# Altium schematic sheet 屏幕驱动.schdoc
size A0; Symbol: Drawing-Symbol_A4; Company: 嘉立创EDA; Version: V1.0; Page Size: A4; @Project Name: 屏幕驱动板; @Update Date: 2026-06-18; @Create Date: 2026-06-18; Device: Drawing-Symbol_A4; @Board Name: Board1; @Page Name: P1; @Create Time: 14:01:21; @Page Count: 1; @Page No: 1; @Schematic Name: Schematic1; @Update Time: 14:01:21; @Assembly Variant: Basic; Border: 1; Title Block Position: 3; Size: A4; Width: 2338; Height: 1652; Region Start: 1; X Region Count: 6; Y Region Count: 4; Blade Width: 10; SheetNumber: 1; SheetTotal: 1
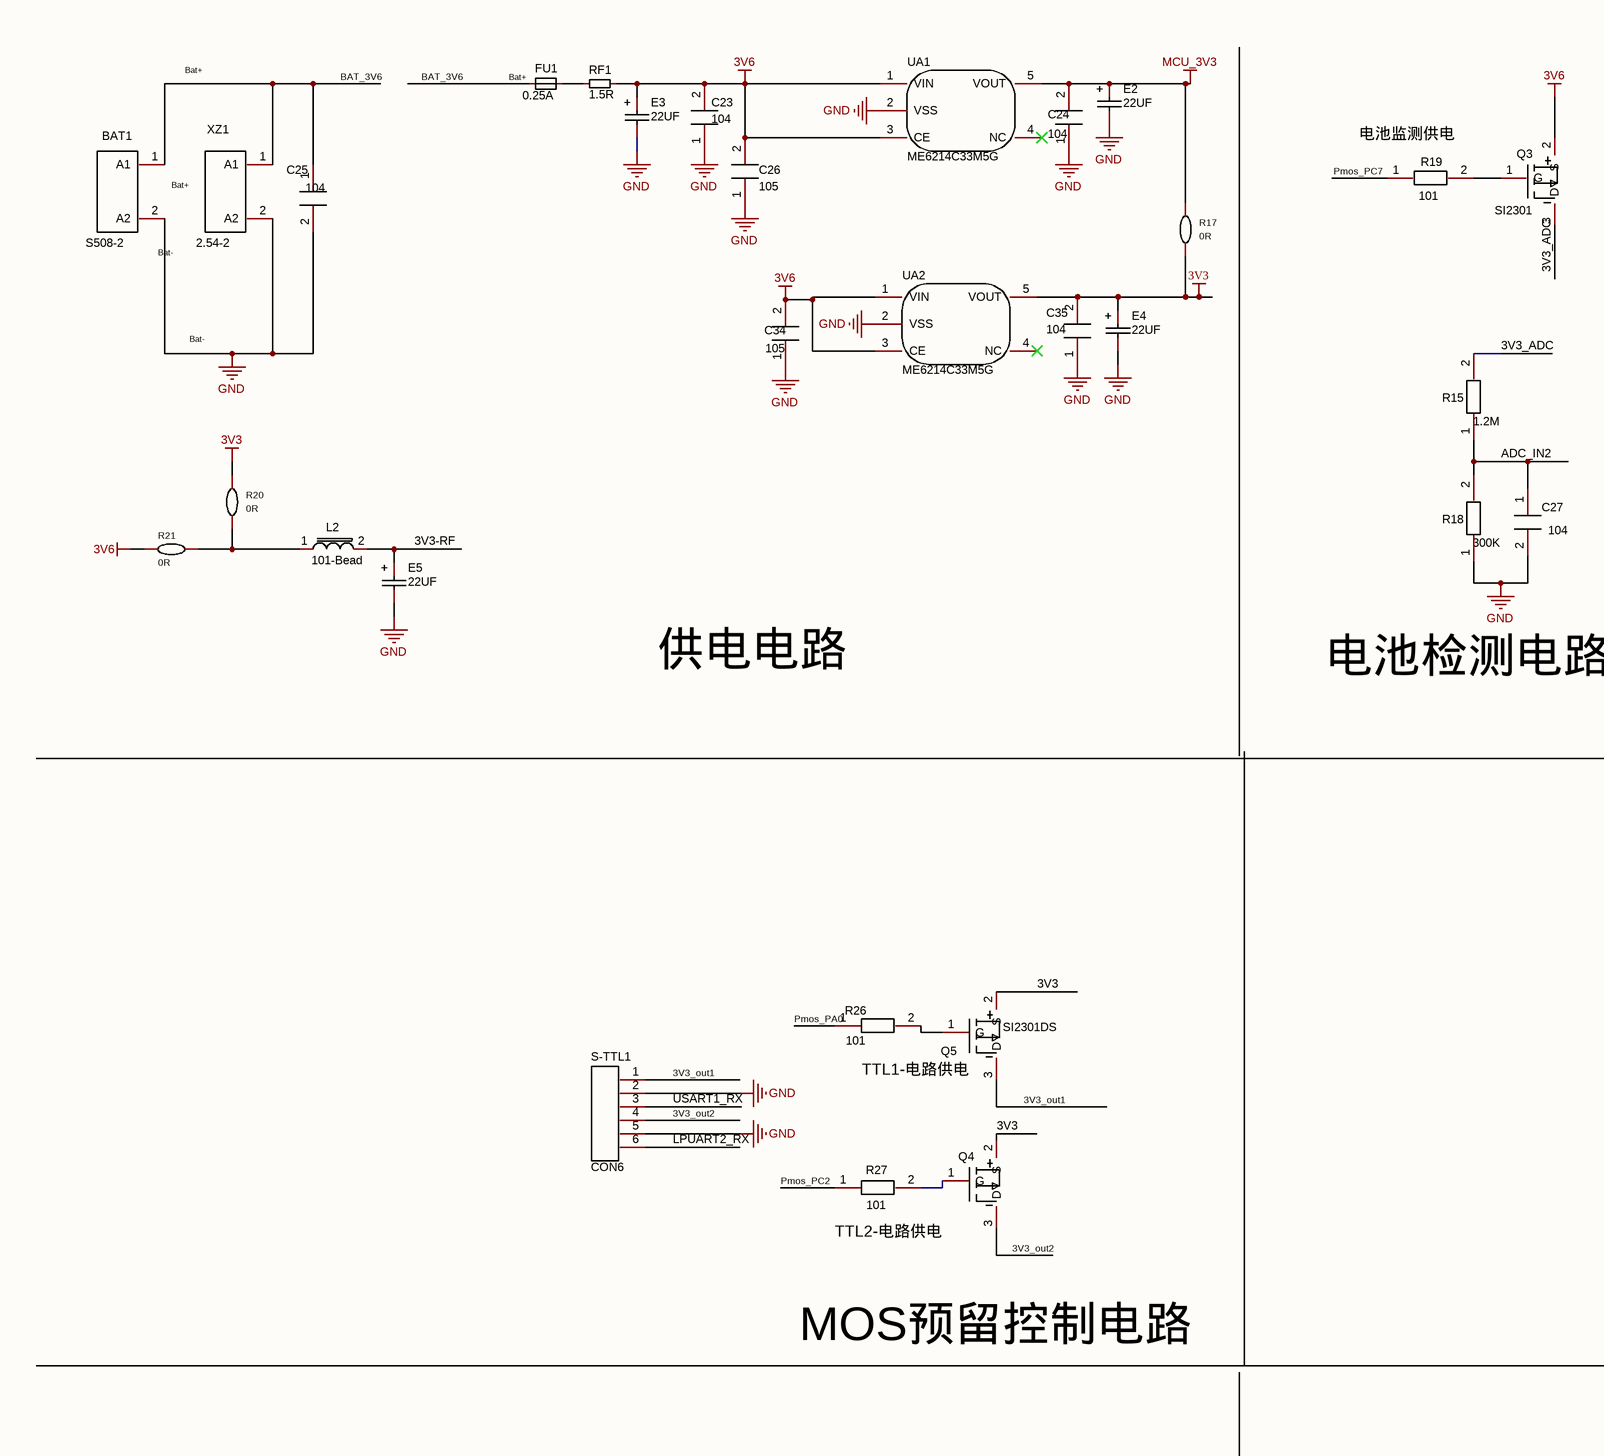
[diagram p0: 屏幕驱动.schdoc, top left]
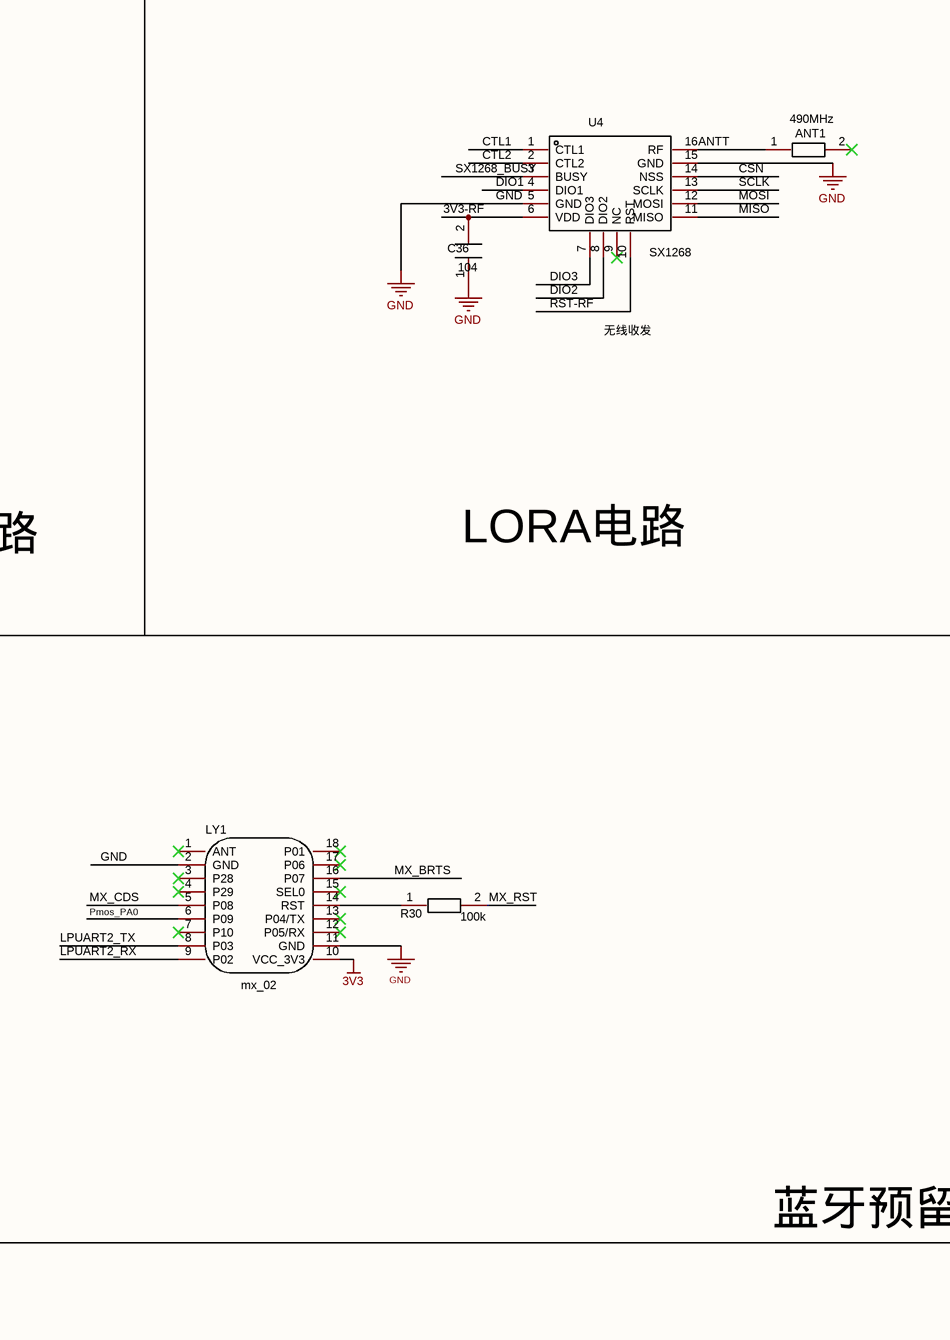
[diagram p1: 屏幕驱动.schdoc, top middle]
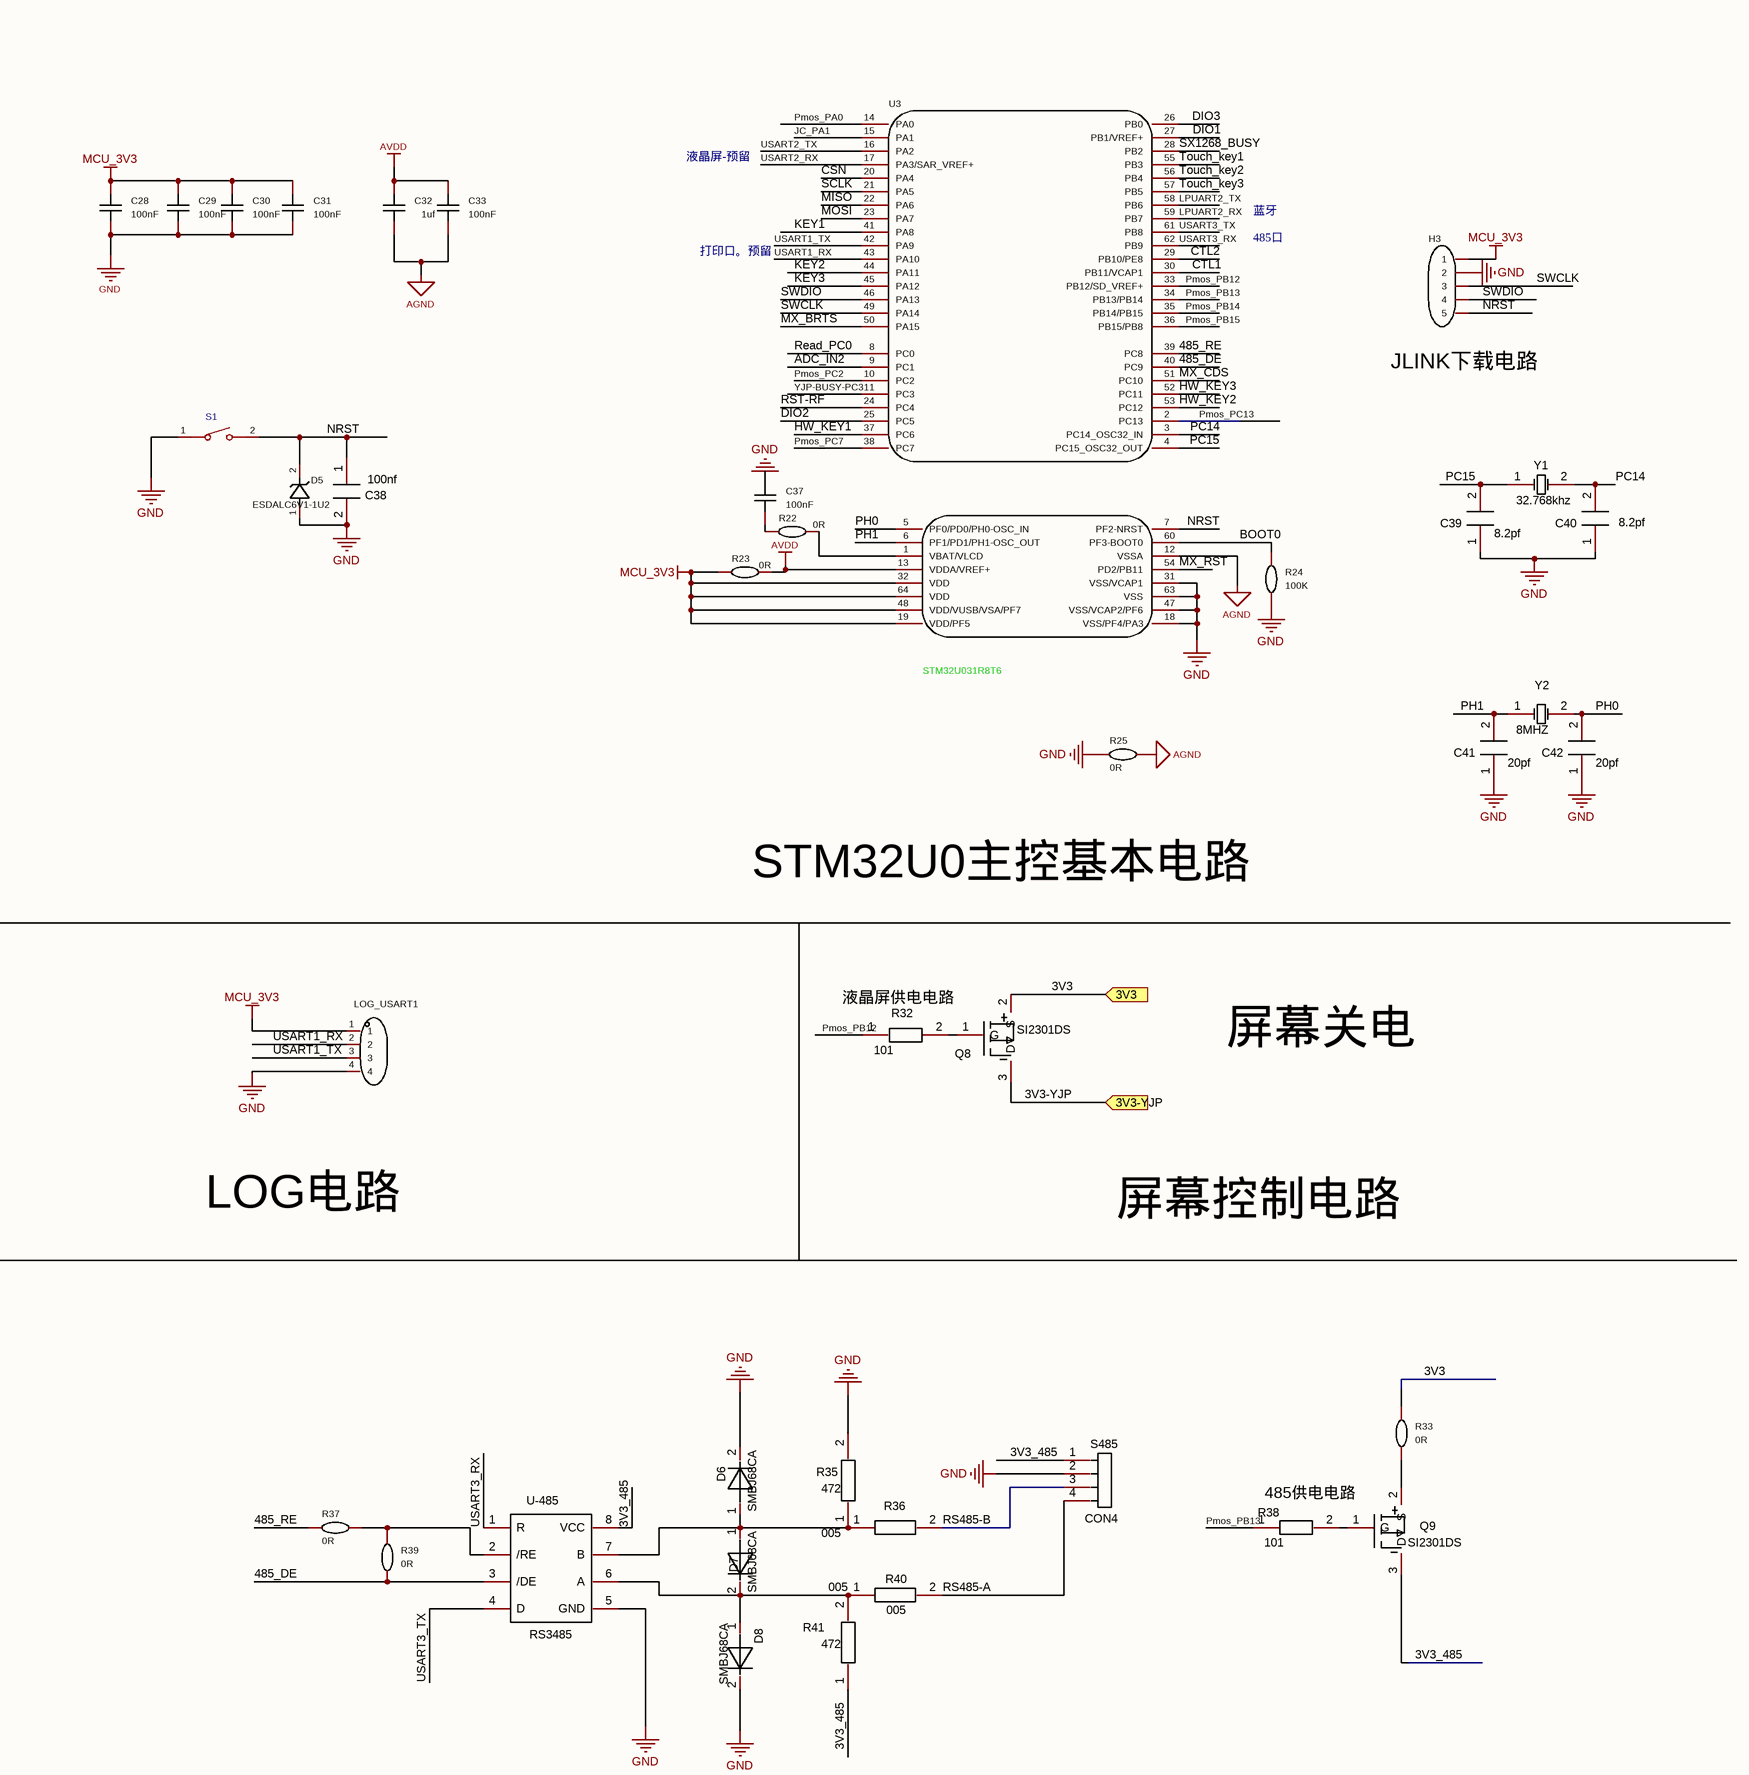
[diagram p2: 屏幕驱动.schdoc, top right]
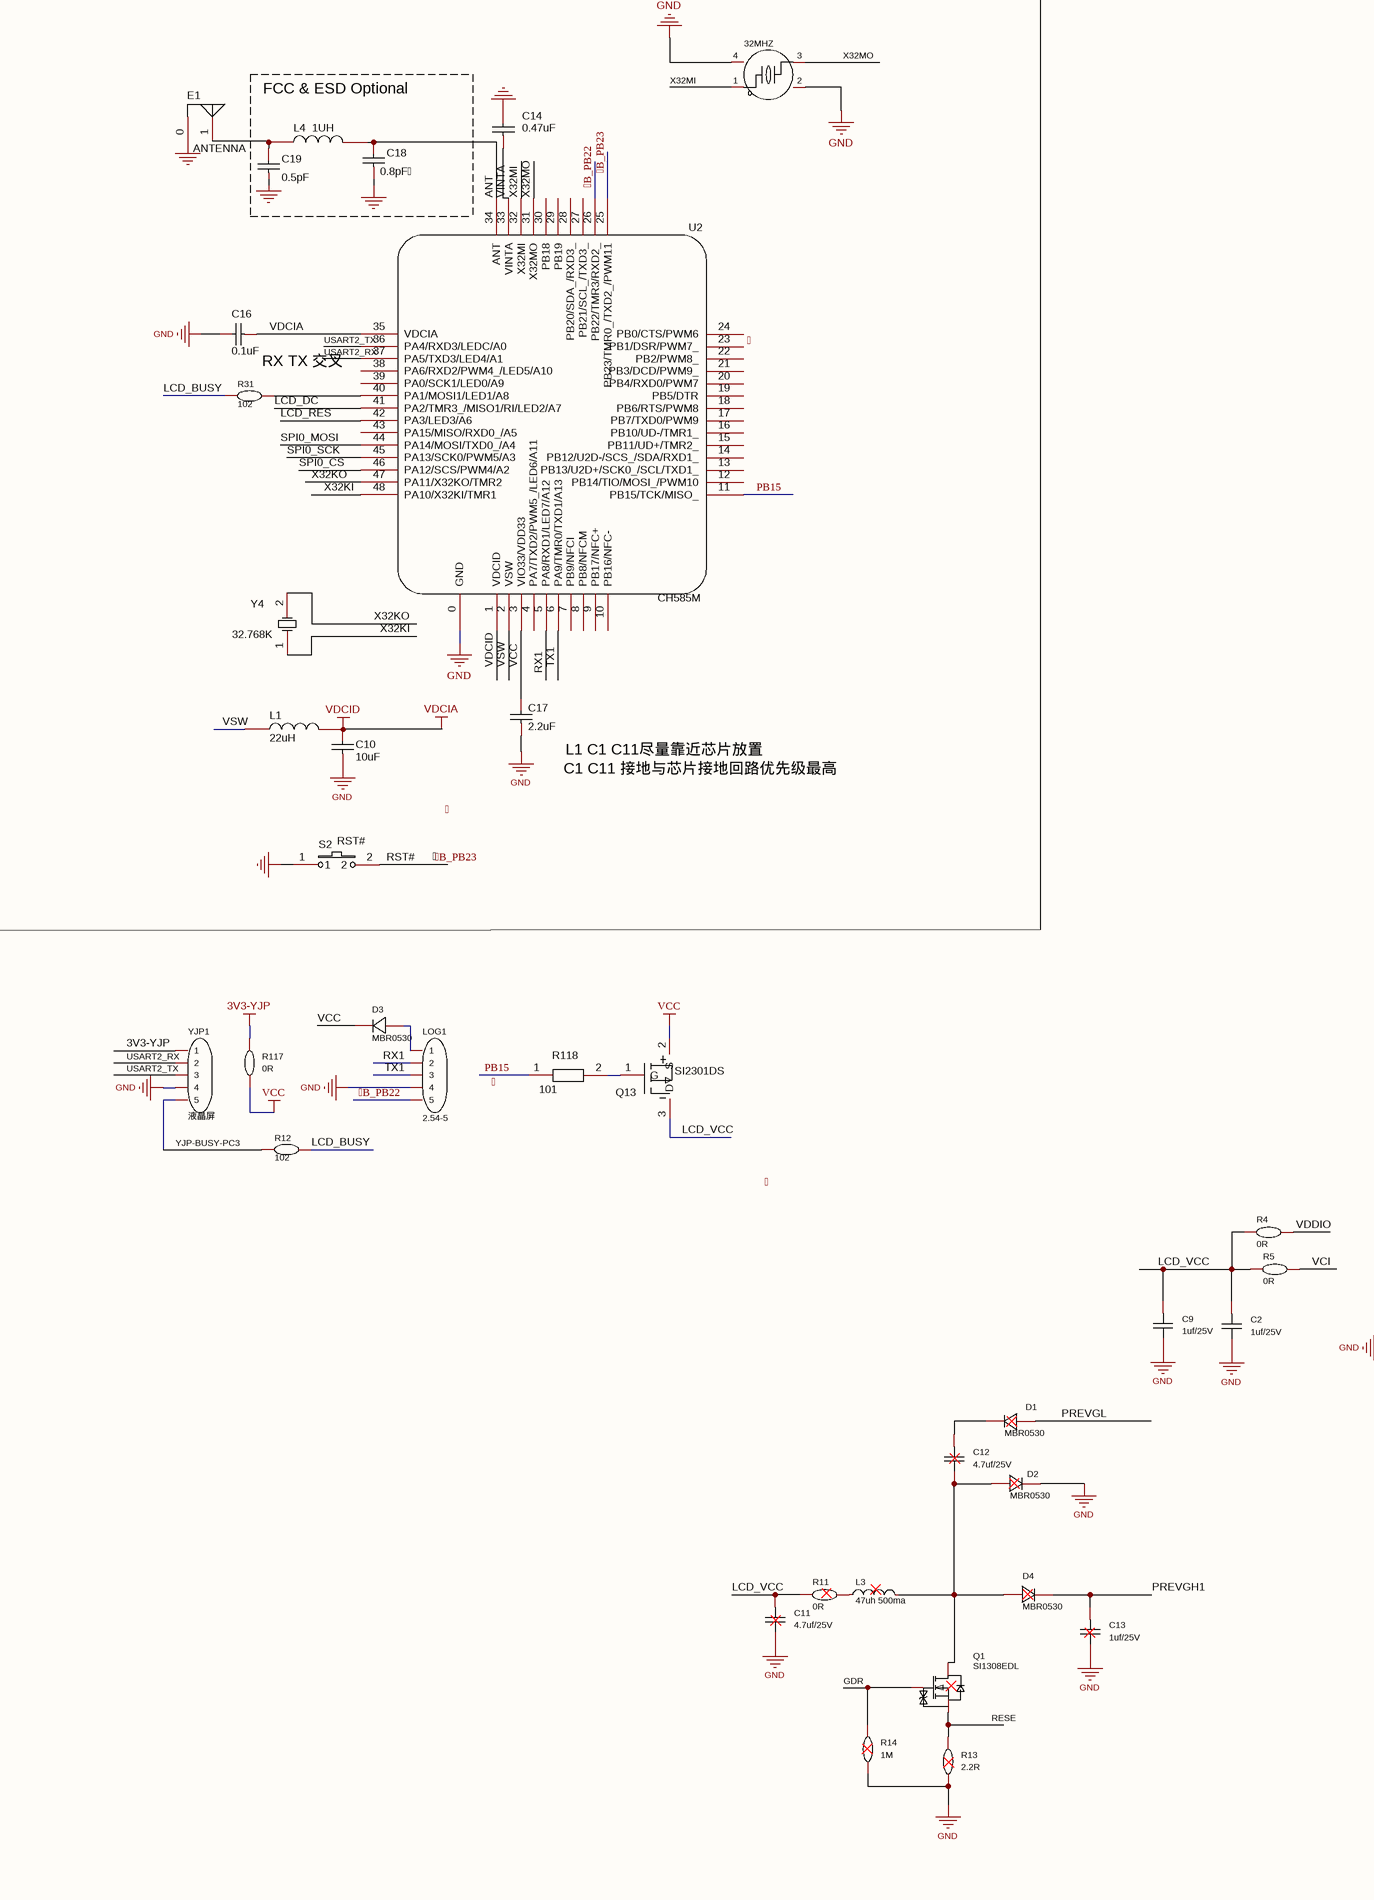
[diagram p3: 屏幕驱动.schdoc, bottom left]
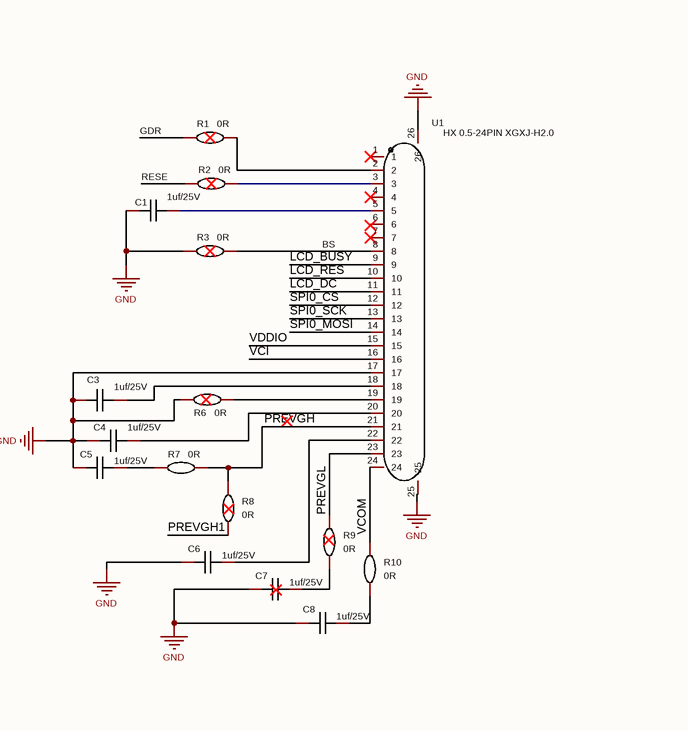
[diagram p4: 屏幕驱动.schdoc, bottom middle]
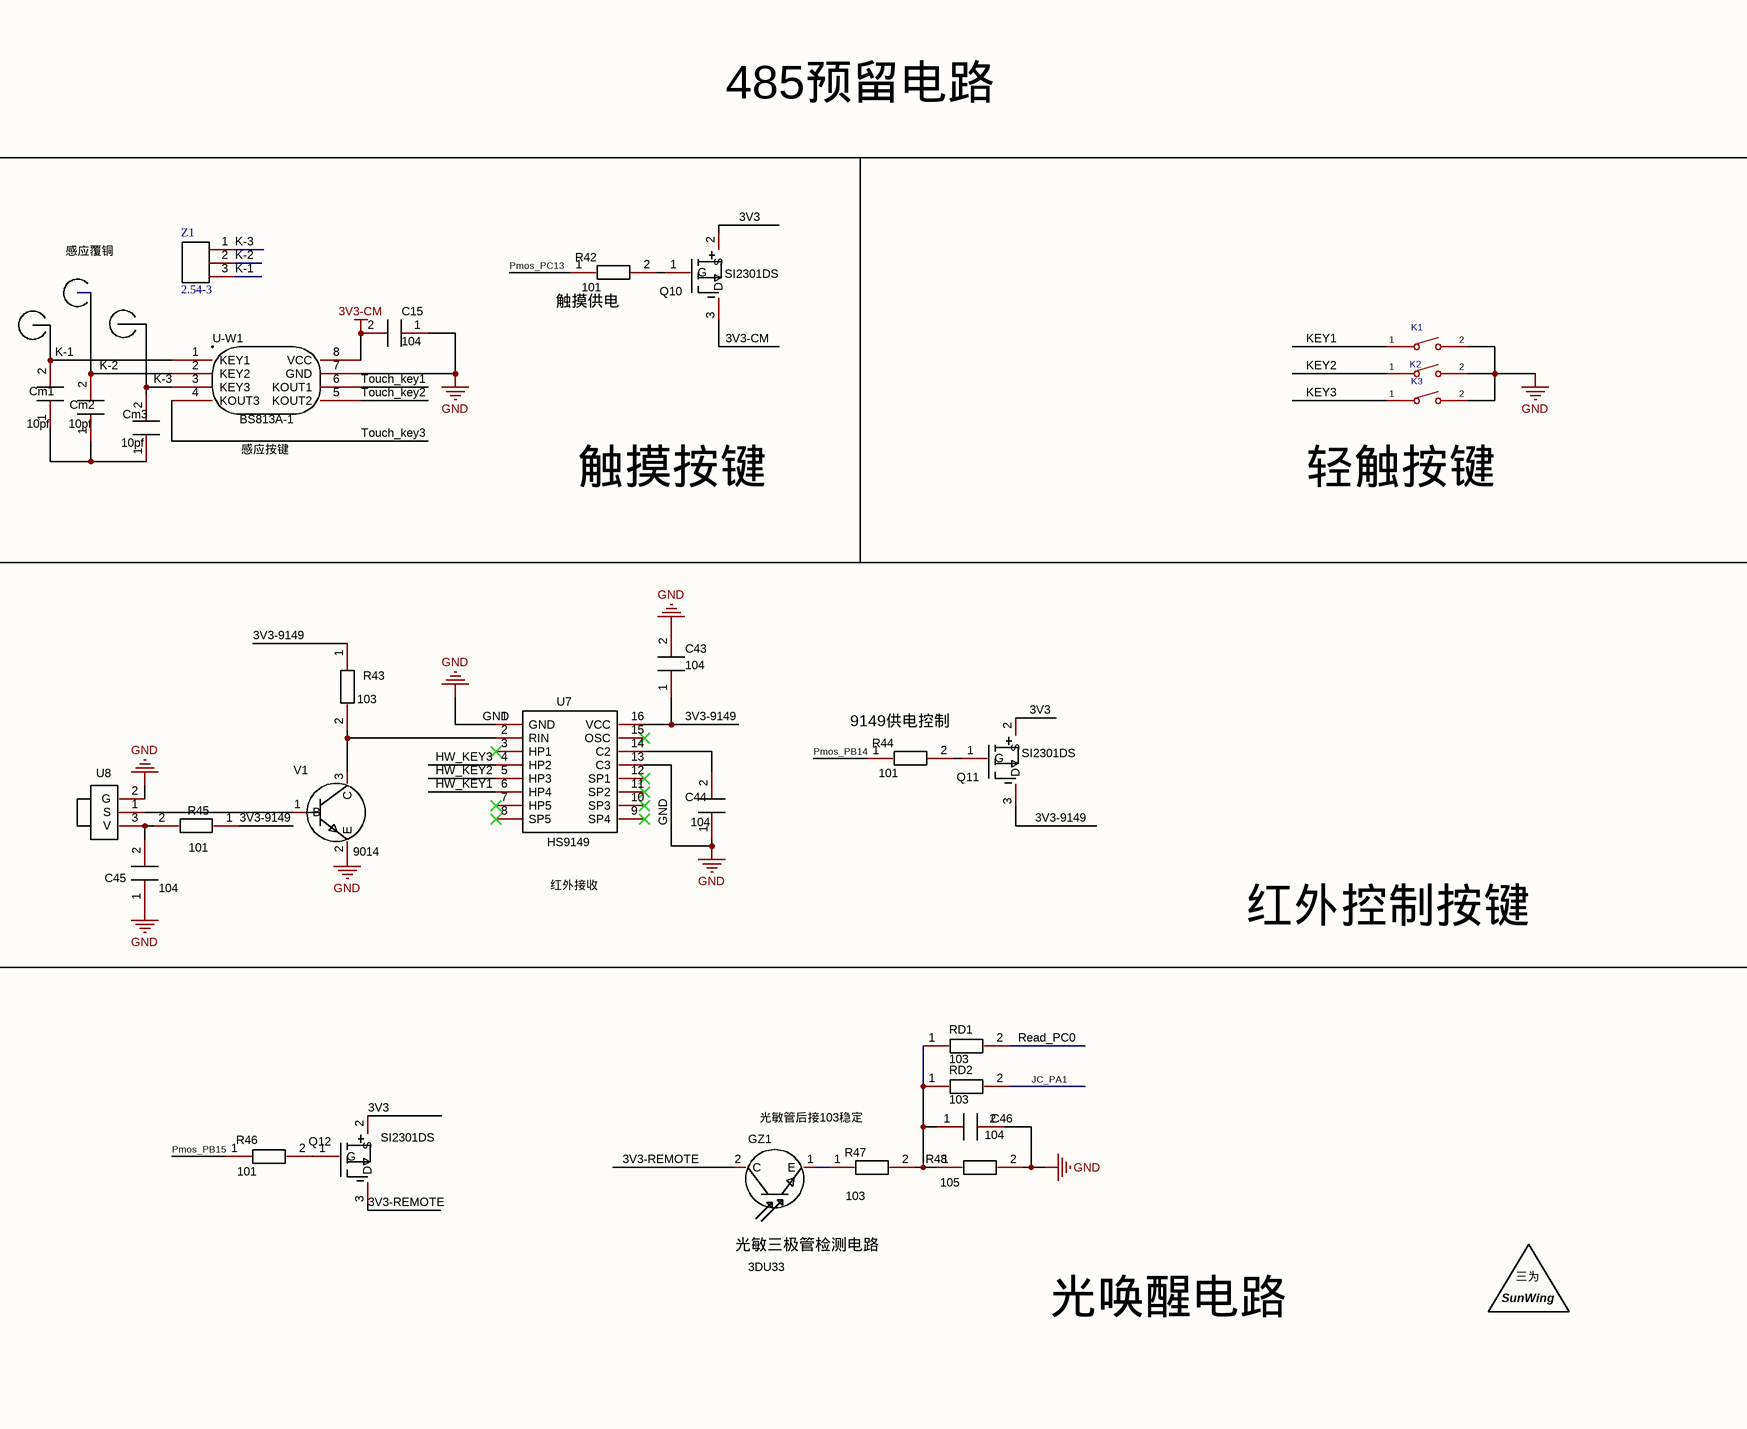
[diagram p5: 屏幕驱动.schdoc, bottom right]

## Parts
32MHZ  (no value)  [32MHZ]
ANT1  value 490MHz  [TX-470-B]
BAT1  S508-2  [5.08HEADER1X2]
C1  1uf/25V  [C 0603]
C2  1uf/25V  [C 0603]
C3  1uf/25V  [C 0603]
C4  1uf/25V  [C 0603]
C5  1uf/25V  [C 0603]
C6  1uf/25V  [C 0603]
C7  1uf/25V  [C 0603]
C8  1uf/25V  [C 0603]
C9  1uf/25V  [C 0603]
C10  10uF  [C 0603]
C11  4.7uf/25V  [C 0603]
C12  4.7uf/25V  [C 0603]
C13  1uf/25V  [C 0603]
C14  0.47uF  [C 0603]
C15  104  [C0603]
C16  0.1uF  [C 0603]
C17  2.2uF  [C 0603]
C18  0.8pF  [C 0603]
C19  0.5pF  [C 0603]
C23  104  [C0603]
C24  104  [C0603]
C25  104  [C0603]
C26  105  [C0603]
C27  104  [C0603]
C28  100nF  [C0603]
C29  100nF  [C0603]
C30  100nF  [C0603]
C31  100nF  [C0603]
C32  1uf  [C0603]
C33  100nF  [C0603]
C34  105  [C0603]
C35  104  [C0603]
C36  104  [C0603]
C37  100nF  [C0603]
C38  100nf  [C0603]
C39  8.2pf  [C0603]
C40  8.2pf  [C0603]
C41  20pf  [C0603]
C42  20pf  [C0603]
C43  104  [C0603]
C44  104  [C0603]
C45  104  [C0603]
C46  104  [C0603]
Cm1  10pf  [C0603]
Cm2  10pf  [C0603]
Cm3  10pf  [C0603]
D1  MBR0530  [SOD-123_L2.7-W1.6-LS3.7-RD-1]
D2  MBR0530  [SOD-123_L2.7-W1.6-LS3.7-RD-1]
D3  MBR0530  [SOD-123_L2.7-W1.6-LS3.7-RD-1]
D4  MBR0530  [SOD-123_L2.7-W1.6-LS3.7-RD-1]
D5  ESDALC6V1-1U2  [SMB]
D6  SMBJ68CA  [SMB]
D7  SMBJ68CA  [SMB]
D8  SMBJ68CA  [SMB]
E1  ANTENNA  [U.FL-IPEX]
E2  22UF  [1210C]
E3  22UF  [1210C]
E4  22UF  [1210C]
E5  22UF  [1210C]
FU1  0.25A  [FU1808-1A]
GZ1  3DU33  [3DU33]
H3  (no value)  [HDR1X5]
K1  TS-1088-AR02016  [SMD4*3*2]  (value not drawn)
K2  TS-1088-AR02016  [SMD4*3*2]  (value not drawn)
K3  TS-1088-AR02016  [SMD4*3*2]  (value not drawn)
L1  22uH  [CD43]
L2  101-Bead  [0805L]
L3  47uh 500ma  [CD43]
L4  1UH  [L  0603]
LOG1  2.54-5  [HDR2.54-LI-5P]
LOG_USART1  (no value)  [HDR1X4]
LY1  mx_02  [MX_02]
Q1  SI1308EDL  [SOT-23-123]
Q3  SI2301  [SOT-23L]
Q4  (no value)  [SOT-23-123]
Q5  value SI2301DS  [SOT-23-123]
Q8  value SI2301DS  [SOT-23-123]
Q9  value SI2301DS  [SOT-23-123]  (hidden comment: SI2301)
Q10  value SI2301DS  [SOT-23-123]
Q11  value SI2301DS  [SOT-23-123]
Q12  value SI2301DS  [SOT-23-123]
Q13  SI2301DS  [SOT-23-123]
R1  0R  [R 0603]
R2  0R  [R 0603]
R3  0R  [R 0603]
R4  0R  [R 0603]
R5  0R  [R 0603]
R6  0R  [R 0603]
R7  0R  [R 0603]
R8  0R  [R 0603]
R9  0R  [R 0603]
R10  0R  [R 0603]
R11  0R  [R 0603]
R12  102  [R 0603]
R13  2.2R  [R 0603]
R14  1M  [R 0603]
R15  value 1.2M  [R 0603_L]
R17  0R  [DJ6MIL]
R18  value 300K  [R 0603_L]
R19  value 101  [R0603]
R20  0R  [R0603]
R21  0R  [R0603]
R22  0R  [R0603]
R23  0R  [R0603]
R24  100K  [R0603]
R25  0R  [R0603]
R26  101  [R0603]
R27  value 101  [R0603]
R30  100k  [R0603]
R31  102  [R 0603]
R32  101  [R0603]
R33  0R  [R0603]
R35  472  [R0603]
R36  005  [R0603]
R37  0R  [R0603]
R38  101  [R0603]
R39  0R  [R0603]
R40  005  [R0603]
R41  472  [R0603]
R42  101  [R0603]
R43  value 103  [R0603]
R44  101  [R0603]
R45  101  [R0603]
R46  101  [R0603]
R47  103  [R0603]
R48  105  [R0603]
R117  0R  [DJ6MIL]
R118  101  [R 0603]
RD1  103  [R0603]
RD2  103  [R0603]
RF1  1.5R  [R 1210_L]
S1  TS-1088-AR02016  [SMD4*3*2]  (value not drawn)
S2  RST#  [SMD4*3*2]
S485  5.08-4  [2.54-S-4]  (value not drawn)
S-TTL1  CON6  [2.54-S-6]
singwing1  SUNWING  [SUNWING]  (value not drawn)
U1  HX 0.5-24PIN XGXJ-H2.0  [FPC-SMD_24P-P0.50_SHOU-HAN_CTSJ-H2.0]
U2  CH585M  [CH584]
U3  (no value)  [LQFP-64_L10.0-W10.0-P0.50-LS12.0-BL]
U4  SX1268  [RF]
U7  HS9149  [SOP16]
U8  HS38BD  [HS/VS1838]  (value not drawn)
U-485  RS3485  [SOP8]
U-W1  BS813A-1  [SOP8]
UA1  ME6214C33M5G  [SOT23-5]
UA2  ME6214C33M5G  [SOT23-5]
V1  9014  [SOT-23-123]
XZ1  2.54-2  [XH2.54-LI-2P]
Y1  32.768khz  [FC-135]
Y2  8MHZ  [OSC HC-49SMD-L]
Y4  32.768K  [FC-135]
YJP1  液晶屏  [液晶屏4.2]
Z1  2.54-3  [XH2.54-LI-3P]

## Blocks framed on the sheet
FCC & ESD Optional: C18 C19 L4

## Ports
3V3 (in), 3V3-YJP (in)

## Nets
3V3: C35.2 E4.1 LY1.10(VCC_3V3) Q4.2(S) Q5.2(S) Q8.2(S) Q10.2(S) Q11.2(S) Q12.2(S) R17.1 R20.2 R33.2 UA2.5(VOUT) ; port 3V3
3V3-CM: C15.2 Q10.3(D) U-W1.8(VCC)
3V3-YJP: Q8.3(D) R117.2 YJP1.1 ; port 3V3-YJP
3V6: C23.2 C26.2 C34.2 E3.1 Q3.2(S) R21.1 RF1.2 UA1.1(VIN) UA1.3(CE) UA2.1(VIN) UA2.3(CE)
AGND: C32.1 C33.1 R25.2 U3.12(VSSA)
AVDD: C32.2 C33.2 R23.2 U3.13(VDDA/VREF+)
GND: 32MHZ.2(GND) 32MHZ.4(GND) BAT1.2(A2) C1.1 C2.1 C3.1 C4.1 C5.1 C6.1 C7.1 C8.1 C9.1 C10.1 C11.1 C13.1 C14.2 C15.1 C16.2 C17.1 C18.1 C19.1 C23.1 C24.1 C25.2 C26.1 C27.2 C28.1 C29.1 C30.1 C31.1 C34.1 C35.1 C36.1 C37.2 C38.2 C39.1 C40.1 C41.1 C42.1 C43.2 C44.1 C45.1 C46.2 D2.1(C) D5.1(K) D6.2 D8.2 E1.0(A) E2.2 E3.2 E4.2 E5.2 H3.2 K1.2 K2.2 K3.2 LOG1.4 LOG_USART1.4 LY1.2(GND) LY1.11(GND) R3.1 R6.1 R13.1 R14.1 R18.1 R24.1 R25.1 R35.2 R48.2 S1.1 S2.1 S485.2 S-TTL1.2 S-TTL1.5 U1.17 U1.25 U1.26 U2.0(GND) U3.18(VSS/PF4/PA3) U3.31(VSS/VCAP1) U3.47(VSS/VCAP2/PF6) U3.63(VSS) U4.5(GND) U4.15(GND) U7.1(GND) U7.13(C3) U8.2(G) U-485.5(GND) U-W1.7(GND) UA1.2(VSS) UA2.2(VSS) V1.2(E) XZ1.2(A2) YJP1.4
MCU_3V3: C24.2 C28.2 C29.2 C30.2 C31.2 E2.1 H3.1 LOG_USART1.1 R17.2 R23.1 U3.19(VDD/PF5) U3.32(VDD) U3.48(VDD/VUSB/VSA/PF7) U3.64(VDD) UA1.5(VOUT)
VCC: C17.2 D3.1(C) Q13.2(S) R117.1 U2.3(VIO33/VDD33)
VDCIA: C10.2 C16.1 L1.2 U2.1(VDCID) U2.35(VDCIA)  [also labelled VDCID]
3V3-9149: C43.1 Q11.3(D) R43.1 R45.1 U7.16(VCC)
3V3-REMOTE: GZ1.2(C) Q12.3(D)
3V3-RF: C36.2 E5.1 L2.2 U4.6(VDD)
3V3_485: Q9.3(D) R41.1 S485.1 U-485.8(VCC)
3V3_ADC: Q3.3(D) R15.2
3V3_out1: Q5.3(D) S-TTL1.1
3V3_out2: Q4.3(D) S-TTL1.4
485_DE: R39.1 U3.40(PC9) U-485.3(/DE)
485_RE: R37.1 U3.39(PC8)
B_PB22: LOG1.5 U2.26(PB22/TMR3/RXD2_)
B_PB23: S2.2 U2.25(PB23/TMR0_/TXD2_/PWM11)  [also labelled RST#]
ADC_IN2: C27.1 R15.1 R18.2 U3.9(PC1)
ANT: C18.2 L4.2 U2.34(ANT)
ANTT: ANT1.1 U4.16(RF)
BAT_3V6: BAT1.1(A1) C25.1 FU1.1 XZ1.1(A1)
BOOT0: R24.2 U3.60(PF3-BOOT0)
BS: R3.2 U1.8
CSN: U3.20(PA4) U4.14(NSS)
CTL1: U3.30(PB11/VCAP1) U4.1(CTL1)
CTL2: U3.29(PB10/PE8) U4.2(CTL2)
DIO1: U3.27(PB1/VREF+) U4.4(DIO1)
DIO2: U3.25(PC5) U4.8(DIO2)
DIO3: U3.26(PB0) U4.7(DIO3)
GDR: Q1.1(G) R1.1 R14.2
HW_KEY1: U3.37(PC6) U7.6(HP4)
HW_KEY2: U3.53(PC12) U7.5(HP3)
HW_KEY3: U3.52(PC11) U7.4(HP2)
JC_PA1: RD2.2 U3.15(PA1)
K-1: Cm1.2 U-W1.1(KEY1) Z1.3
K-2: Cm2.2 U-W1.2(KEY2) Z1.2
K-3: Cm3.2 U-W1.3(KEY3) Z1.1
KEY1: K1.1 U3.41(PA8)
KEY2: K2.1 U3.44(PA11)
KEY3: K3.1 U3.45(PA12)
LCD_BUSY: R12.2 R31.1 U1.9
LCD_DC: U1.11 U2.41(PA2/TMR3_/MISO1/RI/LED2/A7)
LCD_RES: U1.10 U2.42(PA3/LED3/A6)
LCD_VCC: C2.2 C9.2 C11.2 Q13.3(D) R4.1 R5.1 R11.1
LPUART2_RX: LY1.9(P02) S-TTL1.6 U3.59(PB7)
LPUART2_TX: LY1.8(P03) U3.58(PB6)
MISO: U3.22(PA6) U4.11(MISO)
MOSI: U3.23(PA7) U4.12(MOSI)
MX_BRTS: LY1.16(P07) U3.50(PA15)
MX_CDS: LY1.5(P08) U3.51(PC10)
MX_RST: R30.2 U3.54(PD2/PB11)
NRST: C38.1 D5.2(A) H3.5 S1.2 U3.7(PF2-NRST)
PB15: R118.1 U2.11(PB15/TCK/MISO_)
PC14: C40.2 U3.3(PC14_OSC32_IN) Y1.2(OSC2)
PC15: C39.2 U3.4(PC15_OSC32_OUT) Y1.1(OSC1)
PH0: C42.2 U3.5(PF0/PD0/PH0-OSC_IN) Y2.2(OSC2)
PH1: C41.2 U3.6(PF1/PD1/PH1-OSC_OUT) Y2.1(OSC1)
Pmos_PA0: LY1.6(P09) R26.1 U3.14(PA0)
Pmos_PB12: R32.1 U3.33(PB12/SD_VREF+)
Pmos_PB13: R38.1 U3.34(PB13/PB14)
Pmos_PB14: R44.1 U3.35(PB14/PB15)
Pmos_PB15: R46.1 U3.36(PB15/PB8)
Pmos_PC2: R27.1 U3.10(PC2)
Pmos_PC7: R19.1 U3.38(PC7)
Pmos_PC13: R42.1 U3.2(PC13)
PREVGH: R7.2 R8.2 U1.21
PREVGH1: C13.2 D4.1(C) R8.1
PREVGL: D1.2(A) R9.2 U1.23
Read_PC0: RD1.2 U3.8(PC0)
RESE: Q1.2(S) R2.1 R13.2
RS485-A: R40.2 S485.4
RS485-B: R36.2 S485.3
RST-RF: U3.24(PC4) U4.10(RST)
RX1: LOG1.2 U2.5(PA8/RXD1/LED7/A12)
SCLK: U3.21(PA5) U4.13(SCLK)
SPI0_CS: U1.12 U2.46(PA12/SCS/PWM4/A2)
SPI0_MOSI: U1.14 U2.44(PA14/MOSI/TXD0_/A4)
SPI0_SCK: U1.13 U2.45(PA13/SCK0/PWM5/A3)
SWCLK: H3.3 U3.49(PA14)
SWDIO: H3.4 U3.46(PA13)
SX1268_BUSY: U3.28(PB2) U4.3(BUSY)
Touch_key1: U3.55(PB3) U-W1.6(KOUT1)
Touch_key2: U3.56(PB4) U-W1.5(KOUT2)
Touch_key3: U3.57(PB5) U-W1.4(KOUT3)
TX1: LOG1.3 U2.6(PA9/TMR0/TXD1/A13)
USART1_RX: LOG_USART1.2 S-TTL1.3 U3.43(PA10)
USART1_TX: LOG_USART1.3 U3.42(PA9)
USART2_RX: U2.37(PA5/TXD3/LED4/A1) U3.17(PA3/SAR_VREF+) YJP1.2
USART2_TX: U2.36(PA4/RXD3/LEDC/A0) U3.16(PA2) YJP1.3
USART3_RX: U3.62(PB9) U-485.1(R)
USART3_TX: U3.61(PB8) U-485.4(D)
VCI: R5.2 U1.16
VCOM: R10.2 U1.24
VDDIO: R4.2 U1.15
VINTA: C14.1 U2.33(VINTA)
VSW: L1.1 U2.2(VSW)
X32KI: U2.48(PA10/X32KI/TMR1) Y4.1(OSC1)
X32KO: U2.47(PA11/X32KO/TMR2) Y4.2(OSC2)
X32MI: 32MHZ.1 U2.32(X32MI)
X32MO: 32MHZ.3 U2.31(X32MO)
YJP-BUSY-PC3: R12.1 U3.11(PC3) YJP1.5
NetC1_2: C1.2 U1.5
NetC3_2: C3.2 U1.18
NetC4_2: C4.2 U1.20
NetC5_2: C5.2 R7.1
NetC6_2: C6.2 U1.22
NetC7_2: C7.2 R9.1
NetC8_2: C8.2 R10.1
NetC12_1: C12.1 D2.2(A) D4.2(A) L3.2 Q1.3(D)
NetC12_2: C12.2 D1.1(C)
NetC19_2: C19.2 E1.1(A) L4.1
NetC37_1: C37.1 R22.1
NetC44_2: C44.2 U7.14(C2)
NetC45_2: C45.2 R45.2 U8.3(V)
NetC46_1: C46.1 R47.2 R48.1 RD1.1 RD2.1
NetCm1_1: Cm1.1 Cm2.1 Cm3.1
NetD3_2: D3.2(A) LOG1.1
NetD6_1: D6.1 D7.1 R35.1 R36.1 U-485.7(B)
NetD7_2: D7.2 D8.1 R40.1 R41.2 U-485.6(A)
NetFU1_2: FU1.2 RF1.1
NetGZ1_1: GZ1.1(E) R47.1
NetL2_1: L2.1 R20.1 R21.2
NetL3_1: L3.1 R11.2
NetLY1_14: LY1.14(RST) R30.1
NetQ3_1: Q3.1(G) R19.2
NetQ4_1: Q4.1(G) R27.2
NetQ5_1: Q5.1(G) R26.2
NetQ8_1: Q8.1(G) R32.2
NetQ9_1: Q9.1(G) R38.2
NetQ9_2: Q9.2(S) R33.1
NetQ10_1: Q10.1(G) R42.2
NetQ11_1: Q11.1(G) R44.2
NetQ12_1: Q12.1(G) R46.2
NetQ13_1: Q13.1(G) R118.2
NetR1_2: R1.2 U1.2
NetR2_2: R2.2 U1.3
NetR6_2: R6.2 U1.19
NetR22_2: R22.2 U3.1(VBAT/VLCD)
NetR31_2: R31.2 U2.40(PA1/MOSI1/LED1/A8)
NetR37_2: R37.2 R39.2 U-485.2(/RE)
NetR43_2: R43.2 U7.2(RIN) V1.3(C)
NetU8_1: U8.1(S) V1.1(B)

Not connected (* = marked no-connect by the designer): ANT1 2*; LY1 1(ANT)* 3(P28)* 4(P29)* 7(P10)* 12(P05/RX)* 13(P04/TX)* 15(SEL0)* 17(P06)* 18(P01)*; U1 1* 4* 6 7*; U2 4(PA7/TXD2/PWM5_/LED6/A11) 7(PB9/NFCI) 8(PB8/NFCM) 9(PB17/NFC+) 10(PB16/NFC-) 12(PB14/TIO/MOSI_/PWM10) 13(PB13/U2D+/SCK0_/SCL/TXD1_) 14(PB12/U2D-/SCS_/SDA/RXD1_) 15(PB11/UD+/TMR2_) 16(PB10/UD-/TMR1_) 17(PB7/TXD0/PWM9) 18(PB6/RTS/PWM8) 19(PB5/DTR) 20(PB4/RXD0/PWM7) 21(PB3/DCD/PWM9_) 22(PB2/PWM8_) 23(PB1/DSR/PWM7_) 24(PB0/CTS/PWM6) 27(PB21/SCL_/TXD3_) 28(PB20/SDA_/RXD3_) 29(PB19) 30(PB18) 38(PA6/RXD2/PWM4_/LED5/A10) 39(PA0/SCK1/LED0/A9) 43(PA15/MISO/RXD0_/A5); U4 9(NC)*; U7 3(HP1)* 7(HP5)* 8(SP5)* 9(SP4)* 10(SP3)* 11(SP2)* 12(SP1)* 15(OSC)*; UA1 4(NC)*; UA2 4(NC)*

## Notes on the sheet
- Bat+
- (near FU1) Bat+
- (near R19) 电池监测供电
- (near BAT1) Bat+
- 液晶屏-预留
- (near BAT1) Bat-
- 打印口。预留
- 蓝牙
- 485口
- Bat-
- (near H3) JLINK下载电路
- 无线收发
- 供电电路
- 电池检测电路
- LORA电路
- STM32U0主控基本电路
- (near R32) 液晶屏供电电路
- TTL1-电路供电
- 屏幕关电
- (near R27) TTL2-电路供电
- LOG电路
- 屏幕控制电路
- MOS预留控制电路
- 蓝牙预留电路
- (near R38) 485供电电路
- RX TX 交叉
- 485预留电路
- 感应覆铜
- (near R42) 触摸供电
- (near U-W1) 感应按键
- C1 C11 接地与芯片接地回路优先级最高
- (near C17) L1 C1 C11尽量靠近芯片放置
- 触摸按键
- (near K3) 轻触按键
- (near R44) 9149供电控制
- 红外接收
- 红外控制按键
- 光敏管后接103稳定
- 光敏三极管检测电路
- 光唤醒电路
- Labels drawn without touching a wire or pin: 
- 创建日期
- 2026-06-18
- 原理图
- 板子
- Schematic1
- Board1
- 更新日期
- 图页
- P1
- 绘制
- 审阅
- 屏幕驱动板
- 版本
- V1.0
- 尺寸
- A4
- 页    1    共    1
- 嘉立创EDA
- (in symbol STM32u031R8T6) STM32U031R8T6
- (in symbol SUNWING) 三为; SunWing
- (in symbol 钽电容) +

## Library data of the parts
32MHZ = SMD3325-4PCristal32MHZ: Manufacturer: YL(惠伦晶体); Manufacturer Part: 3S32000136; Value: 32MHz; Crystal Type: 贴片晶振; Normal temperature Frequency Tolerance: ±10ppm; External load capacitor: 8pF; Frequency Stability(Full temperature range): ±20ppm; Equivalent Series Resistance (ESR): 30Ω; Origin Footprint 2: OSC-SMD_4P-L3.2-W2.5-BL; AddInBom: yes; Symbol: SMD3325-4PCristal32MHZ; Device: SMD3325-4PCristal32MHZ; Supplier: LCSC; Supplier Part: C516583; JLCPCB Part Class: Extended Part; LCSC Part Name: 32MHz ±10ppm 8pF; Supplier Footprint: SMD3225-4P; Datasheet: https://atta.szlcsc.com/upload/public/pdf/source/20200424/C516567_686309201FBE57D70798F9FD1221EE82.pdf; Operating Temperature: -40℃~+85℃; ConvertToPcb: yes; FootprintName: SMD3225-4PCristal32MHZ
ANT1 = RES_3: Symbol: RES; PCB DECAL: 0603R; AddInBom: yes; Device: RES_3; Origin Footprint: TX-470-B; DesignItemID: RES; LibraryName: *
BAT1 = CON2_1: Symbol: CON2; AddInBom: yes; Device: CON2_1; PCB DECAL: 5.08HEADER1X2; Origin Footprint: 5.08HEADER1X2; DesignItemID: CON2; LibraryName: *
C1-C9 C11-C13 C28-C33 C37 = CAP_0603: Symbol: Capacitance; ConvertToPcb: yes; ModelId: ac125912035d415993ca9572d50418b1聨0819f05c4eef4c71ace90d822a990e87; ModelName: C0603_L1.6-W0.8-H0.8; ModelTransform: 62.992,31.496,0,0,0,0,0,0,0; Device: CAP_0603; AddInBom: yes; Supplier Footprint: 0603; FootprintName: C0603
  C1-C9 C13: Value: 1uf/25V
  C11 C12: Value: 4.7uf/25V
  C28-C31 C33 C37: Value: 100nF
  C32: Value: 1uf
C10 = 4.7uF: Capacitor; Symbol: CAP; Origin Footprint: 0402_C; AddInBom: yes; Device: 4.7uF; DesignItemID: CAP; LibraryName: *
C14 = 0.47uF: Capacitor; Symbol: CAP; Origin Footprint: 0402_C; AddInBom: yes; Device: 0.47uF; DesignItemID: CAP; LibraryName: *
C15 = CAP_2: Symbol: CAP; PCB DECAL: 0805C; AddInBom: yes; Device: CAP_2; Origin Footprint: 0805C; DesignItemID: CAP; LibraryName: Sensor V1.1
C16 = 0.1uF: Capacitor; Symbol: CAP; Origin Footprint: 0402_C; AddInBom: yes; Device: 0.1uF; DesignItemID: CAP; LibraryName: *
C17 = 2.2uF: Capacitor; Symbol: CAP; Origin Footprint: 0402_C; AddInBom: yes; Device: 2.2uF; DesignItemID: CAP; LibraryName: *
C18 = NC(可用于ESD器件): Capacitor; Symbol: CAP; Origin Footprint: 0402_C; AddInBom: yes; Device: NC(可用于ESD器件); DesignItemID: CAP; LibraryName: *
C19 = 0.5pF: Capacitor; Symbol: CAP; Origin Footprint: 0402_C; AddInBom: yes; Device: 0.5pF; DesignItemID: CAP; LibraryName: *
C23 C24 C35 = CAP_4: Symbol: CAP; AddInBom: yes; ModelId: fca5be93b99f4b5a9a2fd372d58c31d9聨0819f05c4eef4c71ace90d822a990e87; Device: CAP_4; PCB DECAL: C0603; Origin Footprint: C0603; DesignItemID: CAP; LibraryName: Sensor V1.1; FootprintName: C0603; ModelName: C0603
  C24 C35: OriginFootprint 2: C0603
C25 C27 C36 C43-C46 = CAP: PCB DECAL: 0805C; AddInBom: yes; Device: CAP; Symbol: CAP; Origin Footprint: 0805C; DesignItemID: CAP; LibraryName: Sensor V1.1
C26 C34 = CAP_5: Symbol: CAP; AddInBom: yes; ModelId: fca5be93b99f4b5a9a2fd372d58c31d9聨0819f05c4eef4c71ace90d822a990e87; Device: CAP_5; PCB DECAL: C0603; Origin Footprint: C0603; OriginFootprint 2: C0603; DesignItemID: CAP; LibraryName: Sensor V1.1; FootprintName: C0603; ModelName: C0603
C38 = CAP_1: Symbol: CAP; PCB DECAL: 0805C; Origin Footprint: 1206C; OriginFootprint 2: C0805_M; AddInBom: yes; Device: CAP_1; DesignItemID: CAP; LibraryName: Sensor V1.1
C39-C42 = CAP_3: Symbol: CAP; PCB DECAL: 0805C; AddInBom: yes; Device: CAP_3; Origin Footprint: 0805C; DesignItemID: CAP; LibraryName: Sensor V1.1
Cm1-Cm3 = CAP_1: Symbol: CAP; PCB DECAL: 0805C; AddInBom: yes; Device: CAP_1; Origin Footprint: 0805C; DesignItemID: CAP; LibraryName: Sensor V1.1
D1-D4 = MBR0530_C77336: 二极管配置:-;正向压降(Vf):550mV@500mA;直流反向耐压(Vr):30V;整流电流:500mA;; Manufacturer: CJ(江苏长电/长晶); AddInBom: yes; ModelId: 7884390a25fb4c08947731ebfba7e3f8聨0819f05c4eef4c71ace90d822a990e87; ModelName: SOD-123_L2.8-W1.8-LS3.7-RD; ModelTransform: 144.8816,62.992,0,0,0,0,0,0,0; Voltage - DC Reverse(Vr): 30V; Current - Rectified: 500mA; Reverse Leakage Current (Ir): 80uA@30V; Non-Repetitive Peak Forward Surge Current: 5.5A; Symbol: MBR0530; Device: MBR0530_C77336; LCSC Part Name: 电压:30V 电流:500mA; SupplierPart: C77336; ManufacturerPart: MBR0530; Supplier Footprint: SOD-123; JLCPCB Part Class: Extended Part; Datasheet: https://item.szlcsc.com/datasheet/MBR0530/78464.html; Supplier: LCSC; ConvertToPcb: yes; FootprintName: SOD-123_L2.8-W1.8-LS3.7-RD; Diode Configuration: -; Voltage - Forward(Vf@If): 550mV@500mA
D5 = ESDALC6V1-1U2: 反向截止电压(Vrwm):3V;最大钳位电压:6.1V;峰值脉冲功率(Ppp):20W;击穿电压:6.1V;; Manufacturer: ST(意法半导体); AddInBom: yes; ModelId: 4169dd28345f488aaf021c72244e18a4聨0819f05c4eef4c71ace90d822a990e87; ModelName: DFN0603-D_L0.6-W0.3-H0.3; ModelTransform: 23.622,11.811,0,0,0,0,0,0,0; Reverse Stand-Off Voltage (Vrwm): 3V; Maximum Clamping Voltage: 6.1V; Peak Pulse Power Dissipation (Ppp): 20W; Number of Lines: 单路; Type: ESD; Symbol: ESDALC6V1-1U2; Device: ESDALC6V1-1U2; LCSC Part Name: ESDALC6V1-1U2; SupplierPart: C1974498; ManufacturerPart: ESDALC6V1-1U2; Supplier Footprint: 0201; JLCPCB Part Class: Extended Part; Datasheet: https://atta.szlcsc.com/upload/public/pdf/source/20210702/A9E16A8F1942D08FD4D8010EFF157F4D.pdf; Supplier: LCSC; ConvertToPcb: yes; FootprintName: DFN0603-D_L0.6-W0.3-P0.34-RD; Breakdown Voltage: 6.1V; Operating Temperature: -40℃~+125℃@(Tj)
D6-D8 = DIODE: PCB DECAL: DIODESMD; OriginFootprint 2: D1206; OriginFootprint 4: Model Name; AddInBom: yes; ModelId: 8331d6bf6a8547598ac6918cf1806f1a聨0819f05c4eef4c71ace90d822a990e87; Device: DIODE; Symbol: DIODE; Value: SMBJ68CA; Origin Footprint: SMB; OriginFootprint 3: D1206; DesignItemID: DIODE; LibraryName: *; ModelName: SMB
E1 = ANTENNA: Generic Antenna; Origin Footprint: ANT-F-1-2.4G-1.6mmFR4; AddInBom: yes; Symbol: ANTENNA; Device: ANTENNA; DesignItemID: ANTENNA; LibraryName: *
E2-E5 = 钽电容: Origin Footprint: 1206C; AddInBom: yes; Device: 钽电容; Symbol: 钽电容; DesignItemID: 钽电容; LibraryName: 激光工程
FU1 = FUSE1: Fuse; Origin Footprint: FU1206; OriginFootprint 2: FUSE2-5*20-26/28; OriginFootprint 3: FU 1206; AddInBom: yes; Device: FUSE1; Symbol: FUSE1; OriginFootprint 4: FU 1206; DesignItemID: FUSE1; LibraryName: 蓝牙锚杆传感器 V1.01-stm32l
GZ1 = 3DU33: AddInBom: yes; Symbol: 3DU33; Device: 3DU33; PCB DECAL: 3DU33; Origin Footprint: 3DU33; DesignItemID: 3DU33; LibraryName: *
H3 LOG1 YJP1 = HDR-F_2.54_1x5P: Symbol: Header-Female-2.54_1x5; 3D Model: f49cb6116a3d45e5a64915bf3e00773f聨0819f05c4eef4c71ace90d822a990e87; 3D Model Transform: 519.684,98.464,0,0,0,0,0,0,-124.016; ConvertToPcb: yes; ModelName: HDR-TH_5P-P2.54-V-F; Device: HDR-F_2.54_1x5P; Supplier Part: C50950; Supplier Footprint: 插件; AddInBom: yes; FootprintName: HDR-TH_5P-P2.54-V-F
L1 = 10uH: Symbol: INDUCTOR; Origin Footprint: SMD_2x2mm; AddInBom: yes; Device: 10uH; DesignItemID: INDUCTOR; LibraryName: *
L2 = INDUCTOR: PCB DECAL: 0805R; AddInBom: yes; Device: INDUCTOR; Symbol: INDUCTOR; Value: 101-Bead; Origin Footprint: 0805L; DesignItemID: INDUCTOR; LibraryName: *
L3 = L_0805: Symbol: SDFL2012S100KTF; AddInBom: yes; ModelId: 37a81e68749a4138bd2dfa6897b24b85聨0819f05c4eef4c71ace90d822a990e87; ModelName: R0805_L2.0-W1.3-H0.6; ModelTransform: 78.74,51.181,0,0,0,0,0,0.001,0; Device: L_0805; Value: 47uh 500ma; Supplier Footprint: L0805; ConvertToPcb: yes; FootprintName: L0805
L4 = 0R: Symbol: INDUCTOR; Origin Footprint: SMD_2x2mm; AddInBom: yes; Device: 0R; DesignItemID: INDUCTOR; LibraryName: *
LOG_USART1 = HDR-F_2.54_1x4P: Symbol: 2.54-1*4P母; ConvertToPcb: yes; ModelId: d187812051054f85879fcaa51a310d8e聨0819f05c4eef4c71ace90d822a990e87; ModelName: HDR-TH_4P-P2.54-V-F; ModelTransform: 419.6842,98.464,0,0,0,0,0,0,-118.11; Device: HDR-F_2.54_1x4P; AddInBom: yes; SupplierPart: C2718488; Supplier Footprint: 插件; FootprintName: HDR-TH_4P-P2.54-V-F
LY1 = mx_02: Add into BOM: yes; Device: mx_02; Symbol: mx_02; Convert to PCB: yes; Origin Footprint: MX_02; DesignItemID: mx_02; LibraryName: MX_02
Q1 = SI1308EDL: 漏源电压(Vdss):30V;连续漏极电流(Id):1.4A;导通电阻(RDS(on)):150mΩ@4.5V,0.5A;耗散功率(Pd):360mW;阈值电压(Vgs(th)):1.5V;; Manufacturer: TECH PUBLIC(台舟); Symbol: SI1308EDL_C7603347; AddInBom: yes; ModelId: 59529c0d6fc749f28f2d0659e12986b4聨0819f05c4eef4c71ace90d822a990e87; ModelName: SOT-323-3_L2.0-W1.3-H1.0-LS2.1-P1.30; ModelTransform: 78.74,82.677,0,90,0,0,0.0005,0,0; Drain to Source Voltage: 30V; Current - Continuous Drain(Id): 1.4A; Pd - Power Dissipation: 360mW; Gate Threshold Voltage (Vgs(th)): 1.5V; Gate Charge(Qg): 2.6nC@4.5V; Input Capacitance(Ciss): 146pF@15V; Reverse Transfer Capacitance (Crss@Vds): 14.8pF@15V; Output Capacitance(Coss): 18.3pF; Device: SI1308EDL; LCSC Part Name: 耐压:30V 电流:1.4A; SupplierPart: C7603347; ManufacturerPart: SI1308EDL; Supplier Footprint: SOT-323; JLCPCB Part Class: Extended Part; Datasheet: https://item.szlcsc.com/datasheet/SI1308EDL/8728853.html; Supplier: LCSC; ConvertToPcb: yes; FootprintName: SOT-323-3_L2.0-W1.3-P1.30-LS2.1-BR; RDS(on): 150mΩ@4.5V,0.5A; Operating Temperature: -55℃~+150℃
Q3 = MOFET-P: Value: SI2301DS; PCB DECAL: SOT-23; Origin Footprint: SOT-23-123; AddInBom: yes; Symbol: MOFET-P; Device: MOFET-P; DesignItemID: MOFET-P; LibraryName: *
Q4 = MOFET-P: Value: SI2301DS; PCB DECAL: SOT-23; AddInBom: yes; Device: MOFET-P; Symbol: MOFET-P; Origin Footprint: SOT-23-123; DesignItemID: MOFET-P; LibraryName: *
Q5 Q8-Q13 = MOFET-P: PCB DECAL: SOT-23; AddInBom: yes; Device: MOFET-P; Symbol: MOFET-P; Origin Footprint: SOT-23-123; DesignItemID: MOFET-P; LibraryName: *
  Q13: Value: SI2301DS
R1-R11 R13 R14 = Res_0603: Symbol: 电阻; ConvertToPcb: yes; ModelId: fc143cca1e79419f9cd78b61e9279f08聨0819f05c4eef4c71ace90d822a990e87; ModelName: R0603; ModelTransform: 31.8897,63.7794,0,90,0,0,0,0,0; Device: Res_0603; AddInBom: yes; Supplier Footprint: 0603; FootprintName: R0603
  R1-R11: Value: 0R
  R13: Value: 2.2R
  R14: Value: 1M
R12 R31 = Res_0603: Symbol: 电阻; Value: 0R; ConvertToPcb: yes; ModelId: fc143cca1e79419f9cd78b61e9279f08聨0819f05c4eef4c71ace90d822a990e87; ModelName: R0603; ModelTransform: 31.8897,63.7794,0,90,0,0,0,0,0; Device: Res_0603; AddInBom: yes; Supplier Footprint: 0603; FootprintName: R0603
R15 R18 = RES: PCB DECAL: 0805R; 3D Model: bc51f3656ded474e90fb470d7004bf28聨0819f05c4eef4c71ace90d822a990e87; AddInBom: yes; Symbol: RES; Device: RES; Origin Footprint: 0805R; DesignItemID: RES; LibraryName: *; ModelName: 0805R
R17 R117 = Res_0603: Symbol: 电阻; 3D Model: fc143cca1e79419f9cd78b61e9279f08聨0819f05c4eef4c71ace90d822a990e87; 3D Model Transform: 31.8897,63.7794,0,90,0,0,0,0,0; ConvertToPcb: yes; ModelName: R0603; Device: Res_0603; Supplier Footprint: 0603; Value: 0R; AddInBom: yes; FootprintName: R0603
R19 = RES: PCB DECAL: 0603R; Origin Footprint: 0805R; 3D Model: bc51f3656ded474e90fb470d7004bf28聨0819f05c4eef4c71ace90d822a990e87; AddInBom: yes; Symbol: RES; Device: RES; DesignItemID: RES; LibraryName: *; ModelName: 0805R
R20-R23 R25 R33 R37 R39 = Res_0603: Symbol: 电阻; ConvertToPcb: yes; ModelId: fc143cca1e79419f9cd78b61e9279f08聨0819f05c4eef4c71ace90d822a990e87; ModelTransform: 31.8897,63.7794,0,90,0,0,0,0,0; Device: Res_0603; Value: 0R; AddInBom: yes; Supplier Footprint: 0603; FootprintName: R0603; ModelName: R0603
R24 = Res_0603: Symbol: 电阻; 3D Model: fc143cca1e79419f9cd78b61e9279f08聨0819f05c4eef4c71ace90d822a990e87; 3D Model Transform: 31.8897,63.7794,0,90,0,0,0,0,0; ConvertToPcb: yes; Device: Res_0603; Supplier Footprint: 0603; Value: 100K; AddInBom: yes; FootprintName: R0603; ModelName: R0603
R26 R32 R38 = RES_1: Symbol: RES; Value: 102; PCB DECAL: 0805R; AddInBom: yes; ModelId: bc51f3656ded474e90fb470d7004bf28聨0819f05c4eef4c71ace90d822a990e87; Device: RES_1; Origin Footprint: 0805R; DesignItemID: RES; LibraryName: *; ModelName: 0805R
R27 = RES: PCB DECAL: 0603R; Origin Footprint: 0805R; AddInBom: yes; ModelId: bc51f3656ded474e90fb470d7004bf28聨0819f05c4eef4c71ace90d822a990e87; Device: RES; Symbol: RES; DesignItemID: RES; LibraryName: *; ModelName: 0805R
R30 = RES_7: Symbol: RES; Value: 102; PCB DECAL: 0805R; AddInBom: yes; ModelId: bc51f3656ded474e90fb470d7004bf28聨0819f05c4eef4c71ace90d822a990e87; Device: RES_7; Origin Footprint: 0805R; DesignItemID: RES; LibraryName: *; ModelName: 0805R
R35 R41 = RES_5: Symbol: RES; PCB DECAL: 0805R; AddInBom: yes; ModelId: bc51f3656ded474e90fb470d7004bf28聨0819f05c4eef4c71ace90d822a990e87; Device: RES_5; Value: 472; Origin Footprint: 0805R; DesignItemID: RES; LibraryName: *; ModelName: 0805R
R36 R40 = RES_6: Symbol: RES; Value: PTC; Origin Footprint: 0805R; AddInBom: yes; ModelId: bc51f3656ded474e90fb470d7004bf28聨0819f05c4eef4c71ace90d822a990e87; Device: RES_6; PCB DECAL: 005; DesignItemID: RES; LibraryName: *; ModelName: 0805R
R42 R44 R46 = RES_1: Symbol: RES; Value: 102; PCB DECAL: 0805R; 3D Model: bc51f3656ded474e90fb470d7004bf28聨0819f05c4eef4c71ace90d822a990e87; AddInBom: yes; Device: RES_1; Origin Footprint: 0805R; DesignItemID: RES; LibraryName: *; ModelName: 0805R
R43 = RES: PCB DECAL: 0805R; AddInBom: yes; ModelId: bc51f3656ded474e90fb470d7004bf28聨0819f05c4eef4c71ace90d822a990e87; Device: RES; Symbol: RES; Origin Footprint: 0805R; DesignItemID: RES; LibraryName: *; ModelName: 0805R
R45 = RES_1: Symbol: RES; PCB DECAL: 0805R; AddInBom: yes; ModelId: bc51f3656ded474e90fb470d7004bf28聨0819f05c4eef4c71ace90d822a990e87; Device: RES_1; Value: 101; Origin Footprint: 0805R; DesignItemID: RES; LibraryName: *; ModelName: 0805R
R47 = RES_2: Symbol: RES; Value: 102; PCB DECAL: 0805R; 3D Model: bc51f3656ded474e90fb470d7004bf28聨0819f05c4eef4c71ace90d822a990e87; AddInBom: yes; Device: RES_2; Origin Footprint: 0805R; DesignItemID: RES; LibraryName: *; ModelName: 0805R
R48 RD1 RD2 = RES_8: Symbol: RES; Value: 102; PCB DECAL: 0805R; 3D Model: bc51f3656ded474e90fb470d7004bf28聨0819f05c4eef4c71ace90d822a990e87; AddInBom: yes; Device: RES_8; Origin Footprint: 0805R; DesignItemID: RES; LibraryName: *; ModelName: 0805R
R118 = RES: Value: 102; PCB DECAL: 0805R; 3D Model: bc51f3656ded474e90fb470d7004bf28聨0819f05c4eef4c71ace90d822a990e87; AddInBom: yes; Symbol: RES; Device: RES; Origin Footprint: 0805R; DesignItemID: RES; LibraryName: *; ModelName: 0805R
RF1 = RES2: Origin Footprint: R 1210_M; OriginFootprint 2: SR0805-X; OriginFootprint 3: SR1206-X; OriginFootprint 4: SR1210-X; OriginFootprint 5: SR2512; OriginFootprint 6: RES-17.2-1W; OriginFootprint 7: RES-12.7-1/2W; AddInBom: yes; Device: RES2; Symbol: RES2; OriginFootprint 8: R 1210_M; DesignItemID: RES2; LibraryName: LEXY-SCHLIB(V1.0)
S2 = RST#: Switch; Symbol: SW-PB; Origin Footprint: SMD_6.1x3.65x2.5mm-KEY; AddInBom: yes; Device: RST#; Published: 24-Mar-1999; LatestRevisionDate: 17-Jul-2002; LatestRevisionNote: Re-released for DXP Platform.; PackageReference: SPST-2; Publisher: Altium Limited; PackageDescription: Switch; 2 Leads; DesignItemID: SW-PB; LibraryName: *
S485 = CON4: PCB DECAL: 5.08HEADER1X4; AddInBom: yes; Device: CON4; Symbol: CON4; Comment_1: CON4; Origin Footprint: 2.54-s-4; DesignItemID: CON4; LibraryName: *
S-TTL1 = CON6: AddInBom: yes; Device: CON6; Symbol: CON6; Origin Footprint: 2.54-s-6; DesignItemID: CON6; LibraryName: Sensor V1.1_4
singwing1 = SUNWING: AddInBom: yes; Device: SUNWING; Symbol: SUNWING; Origin Footprint: sunwing; DesignItemID: SUNWING; LibraryName: Sensor V1.1
U1 = HX 0.5-24PIN XGXJ-H2.0: 锁定特性:翻盖式;触点类型:下接;触点数量:24P;间距:0.5mm;安装方式:卧贴;工作温度:-25℃~+85℃;; Manufacturer: hanxia(韩下); AddInBom: yes; ModelId: fcd60383a6074ec18506c038d466bb51聨0819f05c4eef4c71ace90d822a990e87; ModelName: FPC-SMD_24P-P0.50_HX-0.5-24PIN-XGXJ-H2.0; ModelTransform: 646.062,236.22,0,0,0,0,0.002,-56.26,0; Locking Feature: 翻盖式; Number of Contacts: 24P; Pitch: 0.5mm; FFC, FCB Thickness: 0.3mm; Rated Voltage (Max): 50V; Current Rating (Max): 400mA; Symbol: HX 0.5-24PIN XGXJ-H2.0; Device: HX 0.5-24PIN XGXJ-H2.0; LCSC Part Name: 翻盖式 下接 P数:24P 间距:0.5mm; SupplierPart: C19269981; ManufacturerPart: HX 0.5-24PIN XGXJ-H2.0; Supplier Footprint: SMD,P=0.5mm,卧贴; JLCPCB Part Class: Extended Part; Datasheet: https://item.szlcsc.com/datasheet/HX%25200.5-24PIN%2520XGXJ-H2.0/20534066.html; Supplier: LCSC; ConvertToPcb: yes; FootprintName: FPC-SMD_24P-P0.50_HX-0.5-24PIN-XGXJ-H2.0; Contact Type: 下接; Mounting Type: 卧贴; Height Above Board: 2mm; Contact Material: 磷青铜; Contact Plating: 锡; Operating Temperature: -25℃~+85℃; Storage Temperature: -
U2 = CH585M: RISC-V MCU with BLE/HSUSB/USB/NFC/ADC/PWM/2*SPI/I2C/4*UART/LCD; Origin Footprint: QFN48_5X5; AddInBom: yes; Symbol: CH585M; Device: CH585M; DesignItemID: CH585M; LibraryName: CHXXX
U3 = STM32u031R8T6: AddInBom: yes; Symbol: STM32u031R8T6; Device: STM32u031R8T6; ConvertToPcb: yes
U4 = SX1268: AddInBom: yes; Device: SX1268; Symbol: SX1268; Origin Footprint: RF; DesignItemID: SX1268; LibraryName: *
U7 = HS9149: PCB DECAL: SO-16; AddInBom: yes; Device: HS9149; Symbol: HS9149; Value: hs9149; Origin Footprint: SOP16; DesignItemID: HS9149; LibraryName: *
U8 = IR-ROMTE: PCB DECAL: INFRARED_RX; AddInBom: yes; Device: IR-ROMTE; Symbol: IR-ROMTE; Origin Footprint: HS/VS1838; DesignItemID: IR-ROMTE; LibraryName: *
U-485 = SN75LBC184: PCB DECAL: SO-8-A; AddInBom: yes; Device: SN75LBC184; Symbol: SN75LBC184; Origin Footprint: SOP8; DesignItemID: SN75LBC184; LibraryName: *
U-W1 = SOP8: AddInBom: yes; Device: SOP8; Symbol: SOP8; Supplier 1: Digikey; Origin Footprint: SOP8; DesignItemID: SOP8; LibraryName: Schlib1
UA1 UA2 = MAV321: MAV321NTR; AddInBom: yes; Device: MAV321; Symbol: MAV321; Origin Footprint: SOT23-5; DesignItemID: MAV321; LibraryName: ZHANG
V1 = NPN: PCB DECAL: SOT-23; AddInBom: yes; 2300: 9014; Device: NPN; Symbol: NPN; Origin Footprint: SOT-23-123; DesignItemID: NPN; LibraryName: *
XZ1 = CON2: PCB DECAL: 5.08HEADER1X2; AddInBom: yes; Device: CON2; Symbol: CON2; Origin Footprint: 2.54-2; DesignItemID: CON2; LibraryName: *
Y1 = XTAL: Crystal Oscillator; Origin Footprint: OSC-3x8-WI-B; AddInBom: yes; Symbol: XTAL; Device: XTAL; Published: 8-Jun-2000; LatestRevisionDate: 17-Jul-2002; LatestRevisionNote: Re-released for DXP Platform.; PackageReference: R38; Publisher: Altium Limited; PackageDescription: Crystal, Thru-Hole; 2 Leads; Body 3.1 x 8.2 mm (Dia.xH); DesignItemID: XTAL; LibraryName: Miscellaneous Devices
Y2 = XTAL_1: Crystal Oscillator; Symbol: XTAL; Origin Footprint: OSC HC-49SMD; AddInBom: yes; Device: XTAL_1; Published: 8-Jun-2000; LatestRevisionDate: 17-Jul-2002; LatestRevisionNote: Re-released for DXP Platform.; PackageReference: R38; Publisher: Altium Limited; PackageDescription: Crystal, Thru-Hole; 2 Leads; Body 3.1 x 8.2 mm (Dia.xH); DesignItemID: XTAL; LibraryName: Miscellaneous Devices
Y4 = 32.768K: Crystal Oscillator; Symbol: XTAL; AddInBom: yes; Device: 32.768K; Published: 8-Jun-2000; LatestRevisionDate: 17-Jul-2002; LatestRevisionNote: Re-released for DXP Platform.; PackageReference: R38; Publisher: Altium Limited; PackageDescription: Crystal, Thru-Hole; 2 Leads; Body 3.1 x 8.2 mm (Dia.xH); Origin Footprint: fc-135; DesignItemID: XTAL; LibraryName: *
Z1 = 4-3
K1-K3 S1 = TS-1088-AR02016: Symbol: TS-1088-AR02016